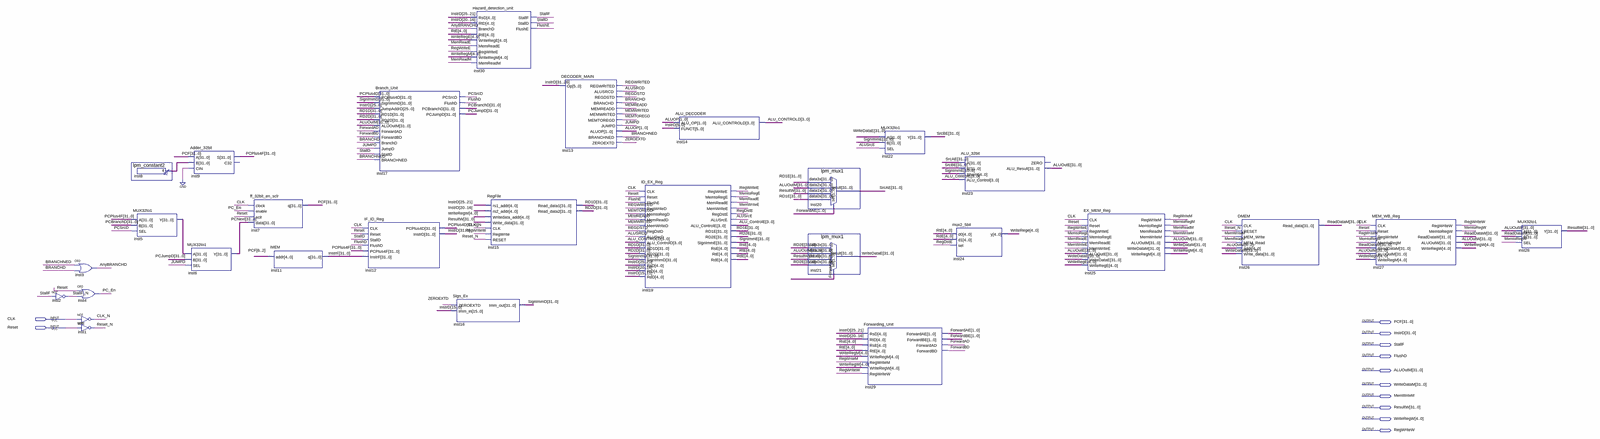
[diagram p0: schematic sheet, whole]
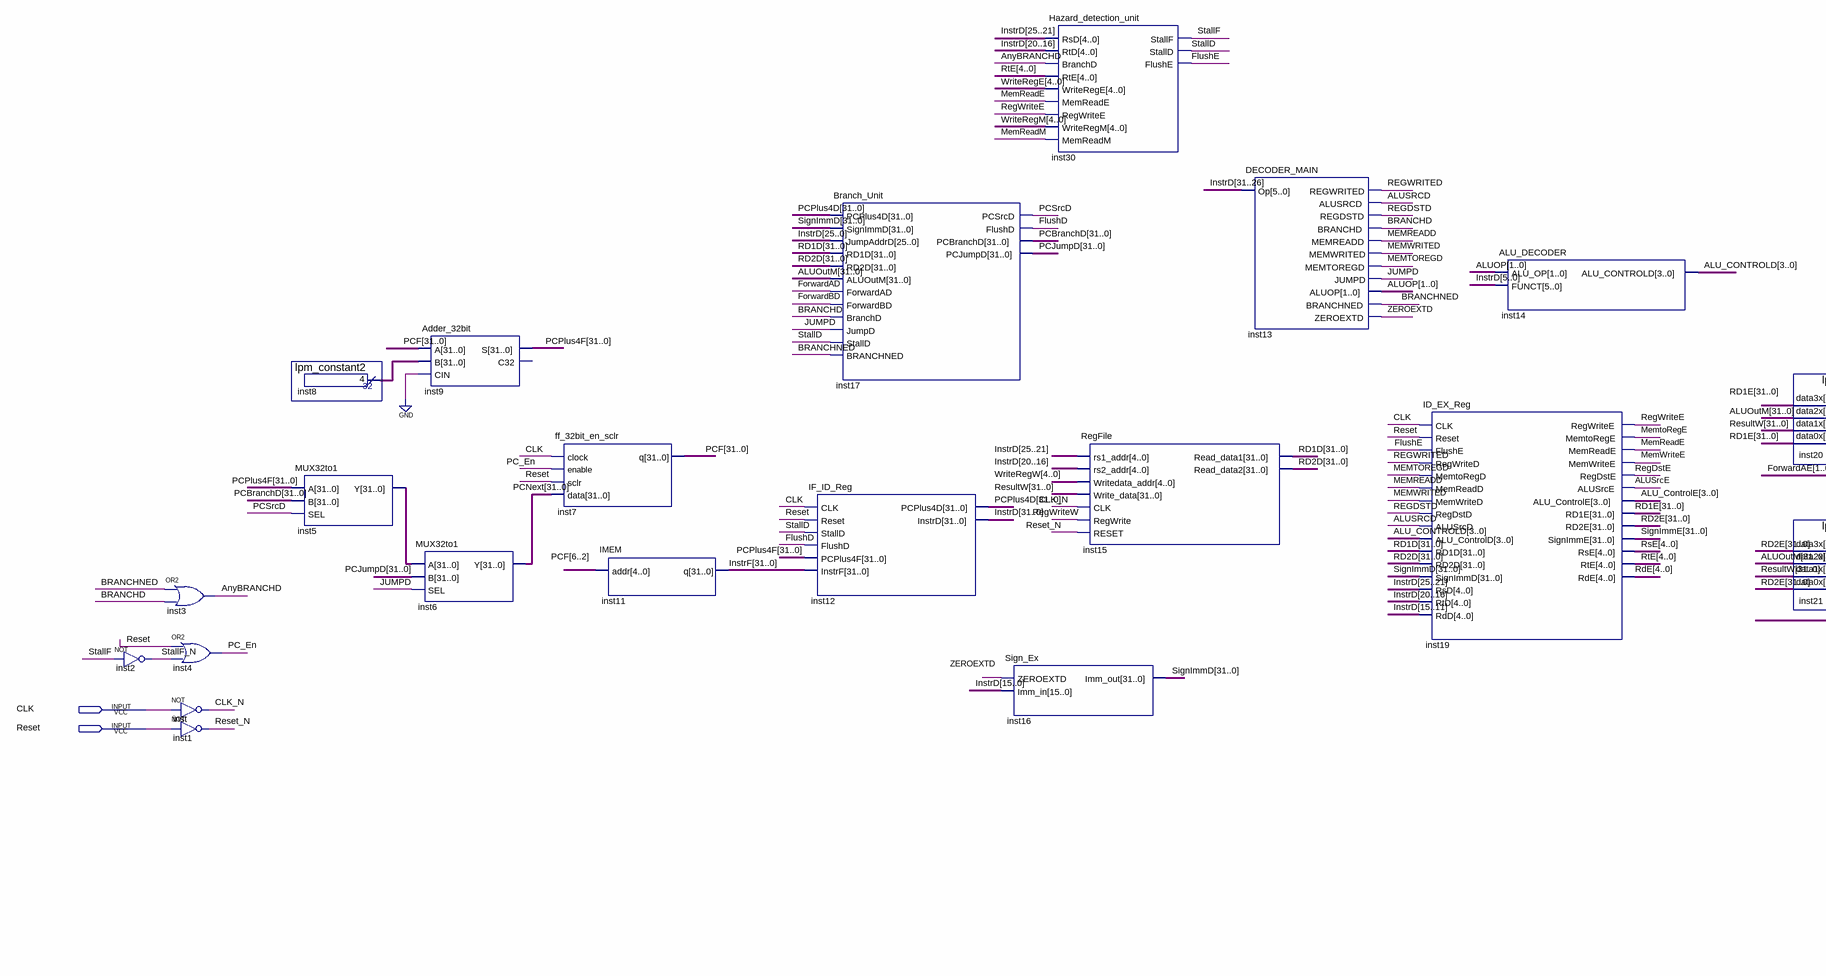
[diagram p1: schematic sheet, left part]
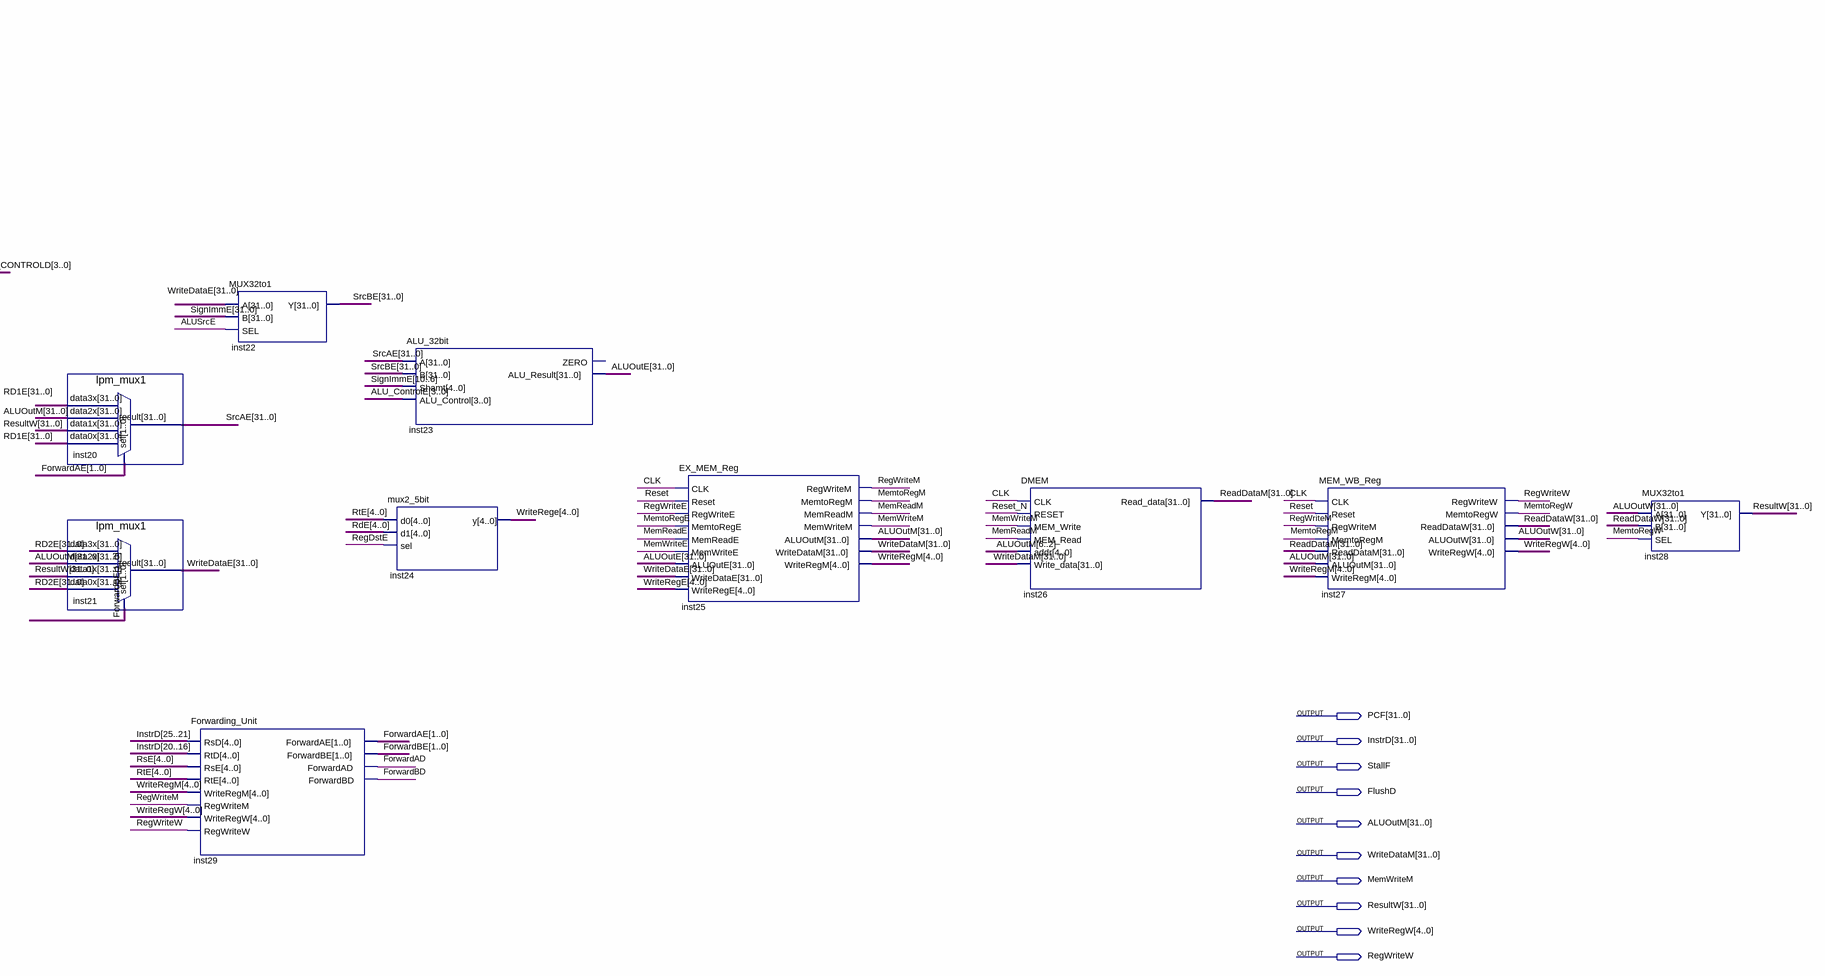
[diagram p2: schematic sheet, right part]
// Quartus schematic MIPS_32BIT_PIPELINE.bdf as structural Verilog: 29 symbols, 12 pins
module MIPS_32BIT_PIPELINE (
  input  CLK,
  input  Reset,
  output [31:0] PCF,
  output [31:0] InstrD,
  output StallF,
  output FlushD,
  output [31:0] ALUOutM,
  output [31:0] WriteDataM,
  output MemWriteM,
  output [31:0] ResultW,
  output [4:0] WriteRegW,
  output RegWriteW
);

  wire ALUSRCD, ALUSrcE, AnyBRANCHD, BRANCHD, BRANCHNED, CLK_N, FlushE, ForwardAD, ForwardBD, JUMPD,
       MEMREADD, MemReadE, MemReadM, MEMTOREGD, MemtoRegE, MemtoRegM, MemtoRegW, MEMWRITED, MemWriteE, PC_En,
       PCSrcD, REGDSTD, RegDstE, REGWRITED, RegWriteE, RegWriteM, Reset_N, StallD, StallF_N, ZEROEXTD;
  wire [1:0] ALUOP, ForwardAE, ForwardBE;
  wire [3:0] ALU_CONTROLD, ALU_ControlE;
  wire [4:0] RdE, RsE, RtE, WriteRegE, WriteRegM;
  wire [31:0] ALUOutE, ALUOutW, inst5_y, inst8_result, InstrF, PCBranchD, PCJumpD, PCNext, PCPlus4D,
       PCPlus4F, RD1D, RD1E, RD2D, RD2E, ReadDataM, ReadDataW, SignImmD, SignImmE, SrcAE, SrcBE, WriteDataE;

  not inst2 (StallF_N, StallF);
  or inst3 (AnyBRANCHD, BRANCHNED, BRANCHD);
  or inst4 (PC_En, Reset, StallF_N);
  not inst (CLK_N, CLK);
  not inst1 (Reset_N, Reset);
  lpm_constant2 inst8 (.result(inst8_result));
  MUX32to1 inst5 (.A(PCPlus4F), .B(PCBranchD), .SEL(PCSrcD), .Y(inst5_y));
  Adder_32bit inst9 (.A(PCF), .B(inst8_result), .CIN(1'b0), .S(PCPlus4F));  // open: C32
  MUX32to1 inst6 (.A(inst5_y), .B(PCJumpD), .SEL(JUMPD), .Y(PCNext));
  ff_32bit_en_sclr inst7 (.clock(CLK), .enable(PC_En), .sclr(Reset), .data(PCNext), .q(PCF));
  IMEM inst11 (.addr(PCF[6:2]), .q(InstrF));
  Branch_Unit inst17 (
    .PCPlus4D(PCPlus4D), .SignImmD(SignImmD), .JumpAddrD(InstrD[25:0]), .RD1D(RD1D), .RD2D(RD2D),
    .ALUOutM(ALUOutM), .ForwardAD(ForwardAD), .ForwardBD(ForwardBD), .BranchD(BRANCHD), .JumpD(JUMPD),
    .StallD(StallD), .BRANCHNED(BRANCHNED), .PCSrcD(PCSrcD), .FlushD(FlushD), .PCBranchD(PCBranchD),
    .PCJumpD(PCJumpD));
  IF_ID_Reg inst12 (
    .CLK(CLK), .Reset(Reset), .StallD(StallD), .FlushD(FlushD), .PCPlus4F(PCPlus4F), .InstrF(InstrF),
    .PCPlus4D(PCPlus4D), .InstrD(InstrD));
  Sign_Ex inst16 (.ZEROEXTD(ZEROEXTD), .Imm_in(InstrD[15:0]), .Imm_out(SignImmD));
  Hazard_detection_unit inst30 (
    .RsD(InstrD[25:21]), .RtD(InstrD[20:16]), .BranchD(AnyBRANCHD), .RtE(RtE), .WriteRegE(WriteRegE),
    .MemReadE(MemReadE), .RegWriteE(RegWriteE), .WriteRegM(WriteRegM), .MemReadM(MemReadM), .StallF(StallF),
    .StallD(StallD), .FlushE(FlushE));
  RegFile inst15 (
    .rs1_addr(InstrD[25:21]), .rs2_addr(InstrD[20:16]), .Writedata_addr(WriteRegW), .Write_data(ResultW),
    .CLK(CLK_N), .RegWrite(RegWriteW), .RESET(Reset_N), .Read_data1(RD1D), .Read_data2(RD2D));
  DECODER_MAIN inst13 (
    .Op(InstrD[31:26]), .REGWRITED(REGWRITED), .ALUSRCD(ALUSRCD), .REGDSTD(REGDSTD), .BRANCHD(BRANCHD),
    .MEMREADD(MEMREADD), .MEMWRITED(MEMWRITED), .MEMTOREGD(MEMTOREGD), .JUMPD(JUMPD), .ALUOP(ALUOP),
    .BRANCHNED(BRANCHNED), .ZEROEXTD(ZEROEXTD));
  ID_EX_Reg inst19 (
    .CLK(CLK), .Reset(Reset), .FlushE(FlushE), .RegWriteD(REGWRITED), .MemtoRegD(MEMTOREGD),
    .MemReadD(MEMREADD), .MemWriteD(MEMWRITED), .RegDstD(REGDSTD), .ALUSrcD(ALUSRCD),
    .ALU_ControlD(ALU_CONTROLD), .RD1D(RD1D), .RD2D(RD2D), .SignImmD(SignImmD), .RsD(InstrD[25:21]),
    .RtD(InstrD[20:16]), .RdD(InstrD[15:11]), .RegWriteE(RegWriteE), .MemtoRegE(MemtoRegE),
    .MemReadE(MemReadE), .MemWriteE(MemWriteE), .RegDstE(RegDstE), .ALUSrcE(ALUSrcE),
    .ALU_ControlE(ALU_ControlE), .RD1E(RD1E), .RD2E(RD2E), .SignImmE(SignImmE), .RsE(RsE), .RtE(RtE),
    .RdE(RdE));
  ALU_DECODER inst14 (.ALU_OP(ALUOP), .FUNCT(InstrD[5:0]), .ALU_CONTROLD(ALU_CONTROLD));
  lpm_mux1 inst20 (.data3x(RD1E), .data2x(ALUOutM), .data1x(ResultW), .data0x(RD1E), .sel(ForwardAE), .result(SrcAE));
  lpm_mux1 inst21 (
    .data3x(RD2E), .data2x(ALUOutM), .data1x(ResultW), .data0x(RD2E), .sel(ForwardBE), .result(WriteDataE));
  MUX32to1 inst22 (.A(WriteDataE), .B(SignImmE), .SEL(ALUSrcE), .Y(SrcBE));
  Forwarding_Unit inst29 (
    .RsD(InstrD[25:21]), .RtD(InstrD[20:16]), .RsE(RsE), .RtE(RtE), .WriteRegM(WriteRegM),
    .RegWriteM(RegWriteM), .WriteRegW(WriteRegW), .RegWriteW(RegWriteW), .ForwardAE(ForwardAE),
    .ForwardBE(ForwardBE), .ForwardAD(ForwardAD), .ForwardBD(ForwardBD));
  ALU_32bit inst23 (
    .A(SrcAE), .B(SrcBE), .Shamt(SignImmE[10:6]), .ALU_Control(ALU_ControlE), .ALU_Result(ALUOutE));  // open: ZERO
  mux2_5bit inst24 (.d0(RtE), .d1(RdE), .sel(RegDstE), .y(WriteRegE));
  EX_MEM_Reg inst25 (
    .CLK(CLK), .Reset(Reset), .RegWriteE(RegWriteE), .MemtoRegE(MemtoRegE), .MemReadE(MemReadE),
    .MemWriteE(MemWriteE), .ALUOutE(ALUOutE), .WriteDataE(WriteDataE), .WriteRegE(WriteRegE),
    .RegWriteM(RegWriteM), .MemtoRegM(MemtoRegM), .MemReadM(MemReadM), .MemWriteM(MemWriteM),
    .ALUOutM(ALUOutM), .WriteDataM(WriteDataM), .WriteRegM(WriteRegM));
  DMEM inst26 (
    .CLK(CLK), .RESET(Reset_N), .MEM_Write(MemWriteM), .MEM_Read(MemReadM), .addr(ALUOutM[6:2]),
    .Write_data(WriteDataM), .Read_data(ReadDataM));
  MEM_WB_Reg inst27 (
    .CLK(CLK), .Reset(Reset), .RegWriteM(RegWriteM), .MemtoRegM(MemtoRegM), .ReadDataM(ReadDataM),
    .ALUOutM(ALUOutM), .WriteRegM(WriteRegM), .RegWriteW(RegWriteW), .MemtoRegW(MemtoRegW),
    .ReadDataW(ReadDataW), .ALUOutW(ALUOutW), .WriteRegW(WriteRegW));
  MUX32to1 inst28 (.A(ALUOutW), .B(ReadDataW), .SEL(MemtoRegW), .Y(ResultW));
endmodule
